# Altium schematic sheet MCU_Power_Section.SchDoc
size A; DocumentNumber: 6; SheetNumber: 6; SheetTotal: 13
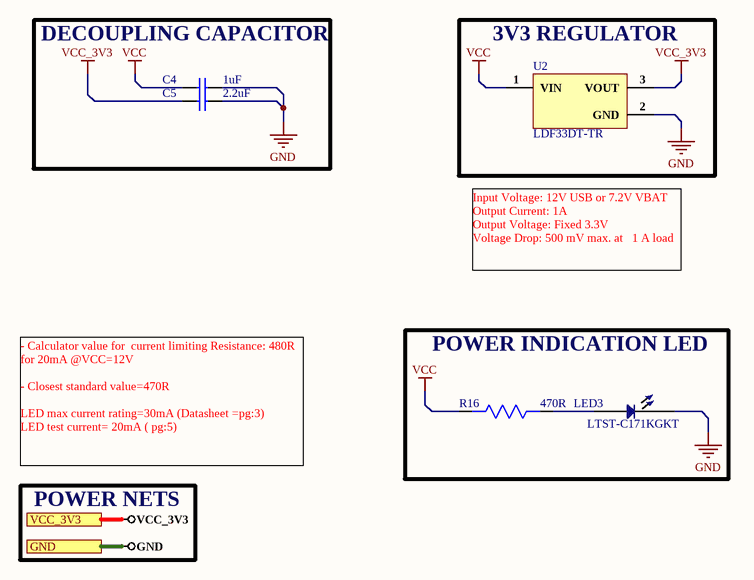
[diagram p0: MCU_Power_Section.SchDoc]

## Parts
C4  1uF  [CAP-0603]
C5  2.2uF  [CAP-0603]
LED3  LTST-C171KGKT  [LED 0805]
R16  470R  [RES-0603]
U2  LDF33DT-TR  [LDF33DT-TR]

## Blocks framed on the sheet
DECOUPLING CAPACITOR: C4 C5
3V3 REGULATOR: U2
POWER INDICATION LED: LED3 R16

## Ports
GND, VCC_3V3

## Nets
GND: C4.2 C5.2 LED3.2 U2.2(GND) ; port GND
VCC: C4.1 R16.2 U2.1(VIN)
VCC_3V3: C5.1 U2.3(VOUT) ; port VCC_3V3
NetLED3_1: LED3.1 R16.1

## Notes on the sheet
- Input Voltage: 12V USB or 7.2V VBAT
  Output Current: 1A
  Output Voltage: Fixed 3.3V
  Voltage Drop: 500 mV max. at   1 A load
- - Calculator value for  current limiting Resistance: 480R for 20mA @VCC=12V
  - Closest standard value=470R
  LED max current rating=30mA (Datasheet =pg:3)
  LED test current= 20mA ( pg:5)
- POWER NETS

## Library data of the parts
C4 = CL10A105KA8NNNC: CAP CER 1UF 25V X5R 0603; Manufacturer: Sams; Tolerance: 10%; Supplier 1: Digi-Key; Manufacturer Part Number: CL10A105KA8NNNC; Stock 1: 2768758; Pricing 1: 1=0.1, 10=0.036, 50=0.0198, 100=0.0161, 500=0.01152, 1000=0.00904 (USD); Mount: Surface Mount; Case/Package: 0603; Min Operating Temperature: -55°C; Max Operating Temperature: 85°C; Capacitance: 1uF; Dielectric: X5R; Voltage Rating (DC): 25V; Voltage: 25V; Length: 1.6mm; Height: 0.8mm; Depth: 0.8mm; Lead Free: Lead Free; Supplier Part Number 1: 1276-1102-1-ND
C5 = CC0603KRX5R8BB225: CAP CER 2.2UF 25V X5R 0603; Manufacturer: Yageo; Tolerance: 10%; Supplier 1: Digi-Key; Manufacturer Part Number: CC0603KRX5R8BB225; Stock 1: 687936; Pricing 1: 1=0.4, 10=0.276, 50=0.1932, 100=0.1656, 500=0.1242, 1000=0.10488 (USD); Mount: Surface Mount; Case/Package: 0603; Case Code (Metric): 1608; Case Code (Imperial): 0603; Weight: 7.1E-05oz; Min Operating Temperature: -55°C; Max Operating Temperature: 85°C; Packaging: Tape and Reel; Capacitance: 2.2uF; Dielectric: X5R; Voltage Rating: 25V; Termination: SMD/SMT; Resistor Type: Ceramic; Voltage Rating (DC): 25V; Package Quantity: 4000; Length: 1.6mm; Width: 0.031inch; Thickness: 0.037inch; Depth: 0.8mm; Radiation Hardening: No; Lead Free: Lead Free; Halogen Free: Halogen Free; RoHS Compliant: Yes; ComponentLink1URL: https://www.verical.com/server-webapp/html/getDatasheet?partID=782757&src-supplier=Verical; ComponentLink1Description: https://www.verical.com/server-webapp/html/getDatasheet?partID=782757&src-supplier=Verical; Supplier Part Number 1: 311-1786-1-ND
LED3 = LTST-C171KGKT: LED GREEN 574nm 2-Pin Chip 0805 SMD; Manufacturer: Vishay Lite-On; Lens Color: Colorless; Viewing Angle: 130°; Lens Style: Rectangular,Diffused,Colorless,Clear; Forward Voltage: 2.4V; Forward Current: 30mA; Luminous Intensity: 35mcd; Dominant Wavelength: 571nm; Test Current: 20mA; Lens Transparency: Clear; Number of Elements: 1; Power Dissipation: 75mW; Reverse Voltage: 5V; Supplier 1: RSComponents; Manufacturer Part Number: LTST-C171KGKT; RoHS: Yes; Category: LEDs; Stock 1: 14250; Pricing 1: 250=0.05900, 500=0.05000, 1250=0.04200, 2500=0.03900 (GBP); Mount: Surface Mount; Case/Package: 0805; Number of Pins: 2; Color: Green; Case Code (Metric): 2012; Case Code (Imperial): 0805; Min Operating Temperature: -55°C; Max Operating Temperature: 85°C; Packaging: Tape and Reel; Package Quantity: 1; Illumination Color: Green; Wavelength: 574nm; Number of LEDs: 1; Power Rating: 75mW; Series: CHIPLED 0805; Length: 2mm; Width: 1.25mm; Height: 0.8mm; Depth: 1.25mm; Radiation Hardening: No; Lead Free: Lead Free; RoHS Compliant: Yes; ComponentLink1URL: https://datasheet.ciiva.com/11774/0900766b80dc0298-11774377.pdf?src-supplier=RSComponents; ComponentLink1Description: https://datasheet.ciiva.com/11774/0900766b80dc0298-11774377.pdf?src-supplier=RSComponents; ComponentLink2URL: https://datasheet.ciiva.com/12400/lite-on-ltst-c171kgkt-187692-12400799.pdf?src-supplier=Mouser; ComponentLink2Description: https://datasheet.ciiva.com/12400/lite-on-ltst-c171kgkt-187692-12400799.pdf?src-supplier=Mouser; ComponentLink3URL: https://datasheet.ciiva.com/16200/lite-on20ltst-c171kgkt-16200100.pdf?src-supplier=Future+Electronics; ComponentLink3Description: https://datasheet.ciiva.com/16200/lite-on20ltst-c171kgkt-16200100.pdf?src-supplier=Future+Electronics; ComponentLink4URL: https://datasheet.ciiva.com/15118/getdatasheetpartid-214542-15118099.pdf?src-supplier=Verical; ComponentLink4Description: https://datasheet.ciiva.com/15118/getdatasheetpartid-214542-15118099.pdf?src-supplier=Verical; ComponentLink5URL: https://datasheet.ciiva.com/2110/s-110-ltst-c171kgkt-2110073.pdf?src-supplier=Digi-Key; ComponentLink5Description: https://datasheet.ciiva.com/2110/s-110-ltst-c171kgkt-2110073.pdf?src-supplier=Digi-Key; ComponentLink6URL: https://datasheet.ciiva.com/2110/s-110-ltst-c171kgkt-2110072.pdf?src-supplier=Digi-Key; ComponentLink6Description: https://datasheet.ciiva.com/2110/s-110-ltst-c171kgkt-2110072.pdf?src-supplier=Digi-Key; ComponentLink7URL: https://datasheet.ciiva.com/2110/s-110-ltst-c171kgkt-2110074.pdf?src-supplier=Digi-Key; ComponentLink7Description: https://datasheet.ciiva.com/2110/s-110-ltst-c171kgkt-2110074.pdf?src-supplier=Digi-Key; Supplier Part Number 1: 6920947P
R16 = ERA3VEB4700V: RES  0.1W, 470½, 0.1%, 0603, RoHS; Manufacturer: Panasonic; Manufacturer Part Number: ERA-3VEB4700V; Supplier 1: Digi-Key; RoHS: No; Category: Chip SMD Resistors; Stock 1: 4950; Pricing 1: 1=0.61000, 10=0.43700, 100=0.22710, 1000=0.12230, 2500=0.11794 (USD); Supplier Part Number 1: 10-ERA-3VEB4700VCT-ND
U2 = LDF33DT-TR: IC REG LINEAR 3.3V 1A DPAK; Manufacturer: STMicroelectronics; Number of Outputs: 1; Min Input Voltage: 2.6V; Max Input Voltage: 16V; Dropout Voltage: 200mV; Polarity: Positive; Quiescent Current: 800uA; Accuracy: 2%; Operating Supply Current: 200uA; Power Supply Rejection Ratio (PSRR): 60dB; Output Type: Fixed; Supplier 1: Digi-Key; Manufacturer Part Number: LDF33DT-TR; Stock 1: 6958; Pricing 1: 1=0.99, 10=0.868, 25=0.8148, 100=0.6178, 250=0.52576, 500=0.49948, 1000=0.434 (USD); Mount: Surface Mount; Case/Package: TO-252-3; Number of Pins: 3; Weight: 0.012346oz; Min Operating Temperature: -40°C; Max Operating Temperature: 125°C; Packaging: Tape and Reel; Max Output Current: 1A; Output Voltage: 3.3V; Nominal Output Voltage: 3.3V; Output Current: 1A; Number of Regulators: 1; Package Quantity: 2500; Radiation Hardening: No; REACH SVHC: No SVHC; Lead Free: Lead Free; RoHS Compliant: Yes; ComponentLink1URL: http://www.st.com/st-web-ui/static/active/en/resource/technical/document/datasheet/DM00099995.pdf?src-supplier=Avnet; ComponentLink1Description: http://www.st.com/st-web-ui/static/active/en/resource/technical/document/datasheet/DM00099995.pdf?src-supplier=Avnet; Supplier Part Number 1: 497-14661-6-ND